# Altium project PCB_interface_batterie_PMP.PrjPcb
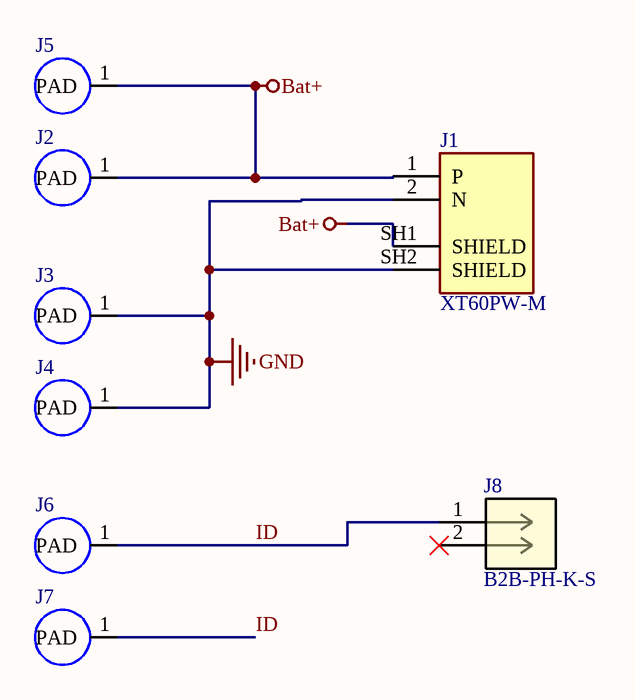
[diagram p0: PCB_interface.SchDoc]
1 sheet, 8 parts. Net scope: global (net labels, ports and power ports of the same name join across sheets).
Board file: PCB_interface.PcbDoc

## Sheet PCB_interface.SchDoc
size A2; SheetNumber: 1; SheetTotal: 1

### Parts
J1  XT60PW-M  [AMASS_XT60PW-M]
J2  Solder Pad 3mm  [Solder_Pad_3mm]  (value not drawn)
J3  Solder Pad 3mm  [Solder_Pad_3mm]  (value not drawn)
J4  Solder Pad 3mm  [Solder_Pad_3mm]  (value not drawn)
J5  Solder Pad 3mm  [Solder_Pad_3mm]  (value not drawn)
J6  Solder Pad 3mm  [Solder_Pad_3mm]  (value not drawn)
J7  Solder Pad 3mm  [Solder_Pad_3mm]  (value not drawn)
J8  B2B-PH-K-S  [CONN2_B2B-PH-K-S_JST]

### Nets
Bat+: J1.1(P) J1.SH1(SHIELD) J2.1(PAD) J5.1(PAD)
GND: J1.2(N) J1.SH2(SHIELD) J3.1(PAD) J4.1(PAD)
ID: J6.1(PAD) J7.1(PAD) J8.1

Not connected (* = marked no-connect by the designer): J8 2*

### Library data of the parts
J1 = XT60PW-M: Socket, DC supply, male, PIN: 2; MF: AMASS; SnapEDA_Link: https://www.snapeda.com/parts/XT60PW-M/AMASS/view-part/?ref=snap; Package: Package; Value: *; MP: XT60PW-M; Check_prices: https://www.snapeda.com/parts/XT60PW-M/AMASS/view-part/?ref=eda
J2-J7 = Solder_Pad: Exclude from BOM: True
J8 = B2B-PH-K-S: Description; Manufacturer_Name: JST; Copyright: Copyright (C) 2026 Ultra Librarian. All rights reserved.; Manufacturer_Part_Number: B2B-PH-K-S; RefDes: RefDes; Type: Type